# EasyEDA Pro project wavie-led-array.epro

# Schematic Schematic1
Board Name: Board1; Create Date: 2026-07-01; Page Name: P1; Project Name: WavieLEDArray; Schematic Name: Schematic1; Update Date: 2026-07-30; Company: ReefMetrics; Page Size: A4; Version: V1.0
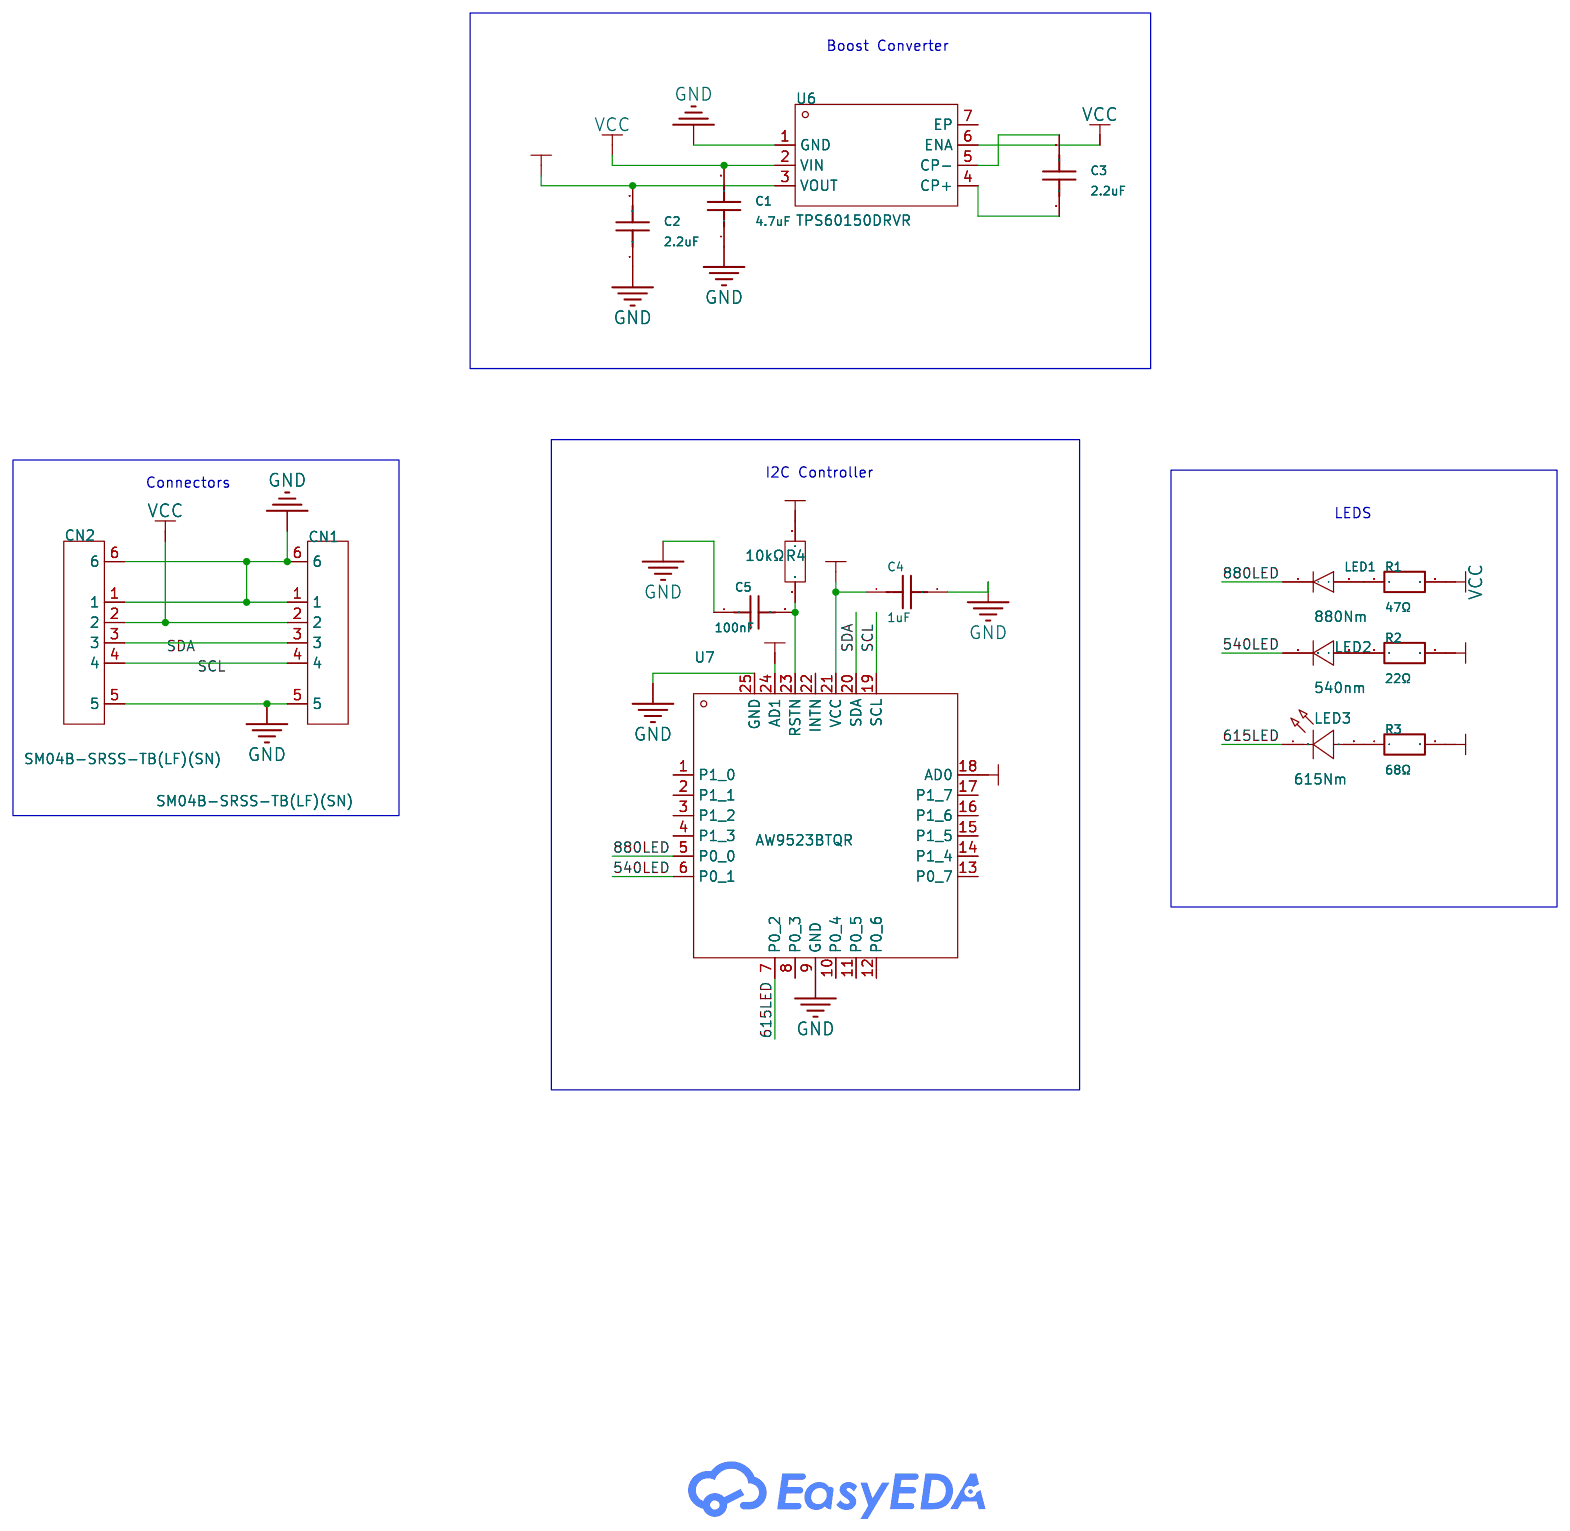
[diagram p0: schematic sheet]

## Parts
C1  4.7uF  [C0603]
C2  2.2uF  [C0603]
C3  2.2uF  [C0603]
C4  1uF  [C0402]
C5  100nF  [C0402]
CN1  SM04B-SRSS-TB(LF)(SN)  [CONN-SMD_4P-P1.00_SM04B-SRSS-TB-LF-SN]
CN2  SM04B-SRSS-TB(LF)(SN)  [CONN-SMD_4P-P1.00_SM04B-SRSS-TB-LF-SN]
LED1  880Nm  [LED0603-RD_XZTHI53W]
LED2  540nm  [LED0603-RD]
LED3  615Nm  [LED0603-RD_1]
R1  47Ω  [R0402]
R2  22Ω  [R0402]
R3  68Ω  [R0402]
R4  10kΩ  [R0402]
U6  TPS60150DRVR  [QFN-6_L2.0-W2.0-P0.65-TL-EP]
U7  AW9523BTQR  [VFQFPN-24_L4.0-W4.0-P0.50-BL-EP2.8]

## Library data of the parts
C1 = TCC0603X7S475K100CTM: Capacitance:4.7uF Tolerance:±10% Tolerance:±10% Voltage Rating:10V Temperature Coefficient:X7S; LCSC Part Name: 4.7uF ±10% 10V; Supplier Part: C54934689; Manufacturer: CCTC(三环); Supplier Footprint: 0603; JLCPCB Part Class: Extended Part; Datasheet: https://item.szlcsc.com/datasheet/TCC0603X7S475K100CTM/58488607.html; Supplier: LCSC; Tolerance: ±10%; Voltage Rating: 10V; Temperature Coefficient: X7S
C2 C3 = 0603X5R225M500NT: Capacitance:2.2uF Tolerance:±20% Tolerance:±20% Voltage Rating:50V Temperature Coefficient:X5R; LCSC Part Name: 2.2uF ±20% 50V; Supplier Part: C49326374; Manufacturer: AIDE(爱迪电容); Supplier Footprint: 0603; JLCPCB Part Class: Extended Part; Datasheet: https://item.szlcsc.com/datasheet/0603X5R225M500NT/51802403.html; Supplier: LCSC; Tolerance: ±20%; Voltage Rating: 50V; Temperature Coefficient: X5R
C4 = 0402ZD105KAT4A: Capacitance:1uF Tolerance:±10% Tolerance:±10% Voltage Rating:10V Temperature Coefficient:X5R; LCSC Part Name: 1uF ±10% 10V; Supplier Part: C6774932; Manufacturer: Kyocera AVX; Supplier Footprint: 0402; JLCPCB Part Class: Extended Part; Supplier: LCSC; Tolerance: ±10%; Voltage Rating: 10V; Temperature Coefficient: X5R
C5 = TCC0402X7R104K500ATM: Capacitance:100nF Tolerance:±10% Tolerance:±10% Voltage Rating:50V Temperature Coefficient:X7R; LCSC Part Name: 100nF ±10% 50V; Supplier Part: C48543623; Manufacturer: CCTC(三环); Supplier Footprint: 0402; JLCPCB Part Class: Extended Part; Datasheet: https://item.szlcsc.com/datasheet/TCC0402X7R104K500ATM/50806393.html; Supplier: LCSC; Tolerance: ±10%; Voltage Rating: 50V; Temperature Coefficient: X7R
CN1 CN2 = SM04B-SRSS-TB(LF)(SN): Pins Structure:1x4P Pitch:1mm Mounting Type:Surface Mount, Right Angle Reference Series:SH Number of Pins:4P Number of Rows:1 Number of PINs Per Row:4 Row Spacing:- Current Rating:1A Contact Material:Copper alloy Contact Plating:Tin Operating Temperature:; LCSC Part Name: 1x4P 间距:1mm 卧贴 系列:SH; Supplier Part: C160404; Manufacturer: JST; Supplier Footprint: SMD,P=1mm,卧贴; JLCPCB Part Class: Extended Part; Datasheet: https://item.szlcsc.com/datasheet/SM04B-SRSS-TB(LF)(SN)/171784.html; Supplier: LCSC; Pins Structure: 1x4P; Pitch: 1mm; Mounting Type: Surface Mount, Right Angle; Reference Series: SH; Number of Pins: 4P; Number of Rows: 1; Number of PINs Per Row: 4; Current Rating: 1A; Contact Material: Copper alloy; Contact Plating: Tin; Operating Temperature: -25℃~+85℃; Voltage Rating: 50V; Plastic Material: PA; Flame Retardant Rating: UL94V-0; Supplementary Features: Auxiliary Solder Pin; Color: White; Z-Height of the Board: 2.9mm; X-Length of Bottom Edge on Board (Spacing Line): 6mm; Y-Width of Bottom Edge on Board: 4.32mm
LED1 = XZTHI53W: Voltage - Forward(Vf):1.3V Voltage - Forward(Vf):1.3V Wavelength:880nm Wavelength:880nm Radiant Intensity:- Operating Temperature:-40℃~+85℃ Operating Temperature:-40℃~+85℃; Supplier Part: C6759194; Manufacturer: SunLED; Supplier Footprint: 0603; JLCPCB Part Class: Extended Part; Datasheet: https://item.szlcsc.com/datasheet/XZTHI53W/7717299.html; Supplier: LCSC; Voltage - Forward(Vf): 1.3V; Wavelength: 880nm; Operating Temperature: -40℃~+85℃
LED2 = LT Q39G-Q1OO-25-1-5-R18: Lamp Holder Type:- Illumination Color:Emerald Green Voltage - Forward(Vf):2.6V~3.1V Voltage - Forward(Vf):2.6V~3.1V Power(Watts):- Forward Current:- Wavelength - Dominant:520nm~540nm Wavelength - Dominant:520nm~540nm Peak Wavelength:525nm Peak Wavelength:; LCSC Part Name: 0603翠绿; Supplier Part: C2900033; Manufacturer: OSRAM(欧司朗); Datasheet: https://item.szlcsc.com/datasheet/LT%2520Q39G-Q1OO-25-1-5-R18/3147960.html; Supplier: LCSC; Illumination Color: Emerald Green; Voltage - Forward(Vf): 2.6V~3.1V; Wavelength - Dominant: 520nm~540nm; Peak Wavelength: 525nm; Lens Color: Water Clear; Luminous Intensity: 71mcd~90mcd; Viewing Angle: 170°; Operating Temperature: -30℃~+85℃
LED3 = SML-D14U2WT86A: Illumination Color:Red Voltage - Forward(Vf):2V Voltage - Forward(Vf):2V Power(Watts):75mW Forward Current:20mA Wavelength - Dominant:615nm Wavelength - Dominant:615nm Diode Configuration:Discrete Diode Lens Color:- Luminous Intensity:160mcd Luminous Inte; LCSC Part Name: 高亮度高可靠性器件; Supplier Part: C5336696; Manufacturer: ROHM(罗姆); Supplier Footprint: 0603; JLCPCB Part Class: Extended Part; Datasheet: https://item.szlcsc.com/datasheet/SML-D14U2WT86A/6102060.html; Supplier: LCSC; Illumination Color: Red; Voltage - Forward(Vf): 2V; Power(Watts): 75mW; Forward Current: 20mA; Wavelength - Dominant: 615nm; Diode Configuration: Discrete Diode; Luminous Intensity: 160mcd; Mounting Style: Top-mount; Operating Temperature: -40℃~+100℃
R1 = 1RC0402F4709: Type:Thick Film Resistor Resistance:47Ω Tolerance:±1% Tolerance:±1% Power(Watts):62.5mW Voltage-Supply(Max):50V Temperature Coefficient:±100ppm/℃ Temperature Coefficient:±100ppm/℃ Operating Temperature:-55℃~+155℃ Operating Temperature:-55℃~+155℃; LCSC Part Name: 厚膜电阻±1%47Ω±100ppm/℃; Supplier Part: C54530894; Manufacturer: SAE(世盟/世爱); Supplier Footprint: 0402; JLCPCB Part Class: Extended Part; Datasheet: https://item.szlcsc.com/datasheet/1RC0402F4709/57883504.html; Supplier: LCSC; Type: Thick Film Resistor; Tolerance: ±1%; Power(Watts): 62.5mW; Voltage-Supply(Max): 50V; Temperature Coefficient: ±100ppm/℃; Operating Temperature: -55℃~+155℃
R2 = 1RC0402F2209: Type:Thick Film Resistor Resistance:22Ω Tolerance:±1% Tolerance:±1% Power(Watts):62.5mW Voltage-Supply(Max):50V Temperature Coefficient:±400ppm/℃ Temperature Coefficient:±400ppm/℃ Operating Temperature:-55℃~+155℃ Operating Temperature:-55℃~+155℃; LCSC Part Name: 厚膜電阻 +1% 22Ω; Supplier Part: C53224179; Manufacturer: SAE(世盟/世爱); Supplier Footprint: 0402; JLCPCB Part Class: Extended Part; Datasheet: https://item.szlcsc.com/datasheet/1RC0402F2209/56267215.html; Supplier: LCSC; Type: Thick Film Resistor; Tolerance: ±1%; Power(Watts): 62.5mW; Voltage-Supply(Max): 50V; Temperature Coefficient: ±400ppm/℃; Operating Temperature: -55℃~+155℃
R3 = TC0225B680JTCC: Type:Thin Film Resistor Resistance:68Ω Tolerance:±0.1% Tolerance:±0.1% Power(Watts):62.5mW Temperature Coefficient:±25ppm/℃ Temperature Coefficient:±25ppm/℃; LCSC Part Name: 薄膜电阻 68Ω ±0.1% 62.5mW; Supplier Part: C29604897; Manufacturer: UNI-ROYAL(厚声); Supplier Footprint: 0402; JLCPCB Part Class: Extended Part; Datasheet: https://item.szlcsc.com/datasheet/TC0225B680JTCC/31331008.html; Supplier: LCSC; Type: Thin Film Resistor; Tolerance: ±0.1%; Power(Watts): 62.5mW; Temperature Coefficient: ±25ppm/℃
R4 = ARG02DTC1002: Type:Thin Film Resistor Resistance:10kΩ Tolerance:±0.5% Tolerance:±0.5% Power(Watts):62.5mW Voltage-Supply(Max):50V Temperature Coefficient:±25ppm/℃ Temperature Coefficient:±25ppm/℃ Operating Temperature:-55℃~+155℃ Operating Temperature:-55℃~+155℃; LCSC Part Name: 薄膜电阻 10kΩ ±0.5% 62.5mW; Supplier Part: C3024422; Manufacturer: Viking(光颉); Supplier Footprint: 0402; JLCPCB Part Class: Extended Part; Datasheet: https://item.szlcsc.com/datasheet/ARG02DTC1002/3551082.html; Supplier: LCSC; Type: Thin Film Resistor; Tolerance: ±0.5%; Power(Watts): 62.5mW; Voltage-Supply(Max): 50V; Temperature Coefficient: ±25ppm/℃; Operating Temperature: -55℃~+155℃
U6 = TPS60150DRVR: Function:boost converter Operating Voltage:2.7V~5.5V Operating Voltage:2.7V~5.5V Output Voltage:4.8V~5.2V Output Voltage:4.8V~5.2V Output Current:140mA Quiescent Current:90uA Output Resistance:- Energy Efficiency:- Switching Frequency:1.5MHz PFM Mode:Not; LCSC Part Name: 5-V, 140-mA电荷泵; Supplier Part: C182429; Manufacturer: TI(德州仪器); Supplier Footprint: WSON-6-EP(2x2); JLCPCB Part Class: Extended Part; Datasheet: https://www.ti.com/cn/lit/ds/symlink/tps60150.pdf; Supplier: LCSC; Function: boost converter; Operating Voltage: 2.7V~5.5V; Output Voltage: 4.8V~5.2V; Output Current: 140mA; Quiescent Current: 90uA; Switching Frequency: 1.5MHz; PFM Mode: Not supported; Operating Temperature: -40℃~+85℃; Features: Overcurrent Protection；Soft-start；Output short-circuit protection
U7 = AW9523BTQR: Interface:I2C Number of I/O:16 Interrupt Output:Interrupt Output Output Type:Push-Pull；Open-drain Current - Output Low(IOL):20mA Current - Output High(IOH):- Clock Frequency:400kHz Number of Supporting Devices:4 Quiescent Supply Current:100nA Output Logic; LCSC Part Name: AW9523B产品手册; Supplier Part: C148077; Manufacturer: AWINIC(艾为); Supplier Footprint: TQFN-24-EP(4x4); Datasheet: https://item.szlcsc.com/datasheet/AW9523BTQR/159410.html; Supplier: LCSC; Interface: I2C; Number of I/O: 16; Interrupt Output: Interrupt Output; Output Type: Push-Pull；Open-drain; Current - Output Low(IOL): 20mA; Clock Frequency: 400kHz; Number of Supporting Devices: 4; Quiescent Supply Current: 100nA; Output Logic Level - Low: 60mV; Features: Built-in LED driver；Reset function；Cascade and address expansion；IO level configurable；Input anti-jitter; Voltage - Supply: 2.4V~5.5V; Operating Temperature: -40℃~+85℃

## Nets
5V: C2.2 C4.1 R2.2 R3.2 R4.1 U6.3(VOUT) U7.18(AD0) U7.21(VCC) U7.24(AD1)
GND: C1.1 C2.1 C4.2 C5.1 CN1.1 CN1.5 CN1.6 CN2.1 CN2.5 CN2.6 U6.1(GND) U7.9(GND) U7.25(GND)
VCC: C1.2 CN1.2 CN2.2 R1.2 U6.2(VIN) U6.6(ENA)
540LED: LED2.1(C) U7.6(P0_1)
615LED: LED3.1(C) U7.7(P0_2)
880LED: LED1.1(-) U7.5(P0_0)
SCL: CN1.4 CN2.4 U7.19(SCL)
SDA: CN1.3 CN2.3 U7.20(SDA)
$1N5156: C3.2 U6.5(CP-)
$1N5165: C3.1 U6.4(CP+)
$1N9825: LED1.2(+) R1.1
$1N9830: LED2.2(A) R2.1
$1N9835: LED3.2(A) R3.1
$1N9899: C5.2 R4.2 U7.23(RSTN)

Not connected (* = marked no-connect by the designer): U6 7(EP); U7 1(P1_0) 2(P1_1) 3(P1_2) 4(P1_3) 8(P0_3) 10(P0_4) 11(P0_5) 12(P0_6) 13(P0_7) 14(P1_4) 15(P1_5) 16(P1_6) 17(P1_7) 22(INTN)

## Notes on the sheet
- Boost Converter
- I2C Controller
- Connectors
- LEDS

# Board PCB2
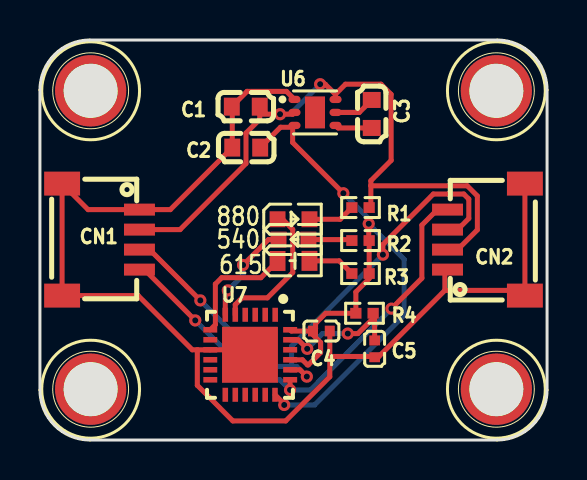
[diagram p1: board, top side]
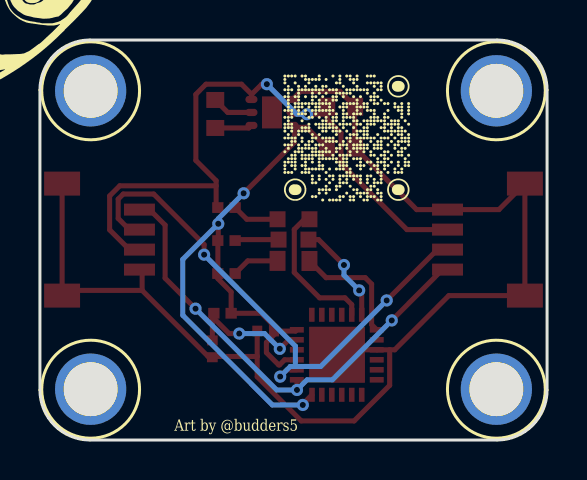
[diagram p2: board, bottom side, seen from below]

Outline 25.4 x 20 mm; copper layers: Top Layer, Bottom Layer. Coordinates in mm from the lower left corner of the outline.
Outline path: 0,17.5 arc(0.73,19.27) 2.5,20 22.9,20 arc(24.67,19.27) 25.4,17.5 25.4,2.5 arc(24.67,0.73) 22.9,0 2.5,0 arc(0.73,0.73) 0,2.5 0,17.5
Stack: Top Layer 0.035mm / Dielectric1 1.51mm FR4 er 4.5 / Bottom Layer 0.035mm

## Design rules (mm)
template: JLCPCB Capability(Two Layers Board)
spacing copperThickness1oz (default): track to track 0.102, other pairs 0.152 to 0.3
spacing copperThickness2oz: track to track 0.203, other pairs 0.152 to 0.3
track width copperThickness1oz (default): min 0.127, default 0.254, max 2.54
track width copperThickness2oz: min 0.203, default 0.254, max 2.54
differential pair differentialPair (default): width min 0.127, default 0.254, max 2.54; gap min 0.152, default 0.152
via viaSize (default): diameter min 0.5, default 0.61, max 10; hole min 0.3, default 0.305, max 6.3

## Placement (name value [footprint] x y rotation side)
C1  4.7uF  [C0603]  10.31 16.67 0 top
C2  2.2uF  [C0603]  10.33 14.62 0 top
C3  2.2uF  [C0603]  16.62 16.3 90 top
C4  1uF  [C0402]  14.1 5.45 0 top
C5  100nF  [C0402]  16.76 4.56 90 top
CN1  SM04B-SRSS-TB(LF)(SN)  [CONN-SMD_4P-P1.00_SM04B-SRSS-TB-LF-SN]  3.05 10.02 270 top
CN2  SM04B-SRSS-TB(LF)(SN)  [CONN-SMD_4P-P1.00_SM04B-SRSS-TB-LF-SN]  22.35 10.02 90 top
LED1  880Nm  [LED0603-RD_XZTHI53W]  12.7 11.04 0 top
LED2  540nm  [LED0603-RD]  12.7 10.02 0 top
LED3  615Nm  [LED0603-RD_1]  12.7 8.95 0 top
M1  MountingHole_2.5mm_Pad  [custom_mount_hole:MountingHole_2.5mm_Pad]  2.54 17.46 0 top
M2  MountingHole_2.5mm_Pad  [custom_mount_hole:MountingHole_2.5mm_Pad]  22.86 17.46 0 top
M3  MountingHole_2.5mm_Pad  [custom_mount_hole:MountingHole_2.5mm_Pad]  22.86 2.54 0 top
M4  MountingHole_2.5mm_Pad  [custom_mount_hole:MountingHole_2.5mm_Pad]  2.54 2.54 0 top
R1  47Ω  [R0402]  16.06 11.62 0 top
R2  22Ω  [R0402]  16.06 9.97 0 top
R3  68Ω  [R0402]  16.06 8.32 0 top
R4  10kΩ  [R0402]  16.26 6.34 0 top
U6  TPS60150DRVR  [QFN-6_L2.0-W2.0-P0.65-TL-EP]  13.78 16.38 0 top
U7  AW9523BTQR  [VFQFPN-24_L4.0-W4.0-P0.50-BL-EP2.8]  10.53 4.26 180 top

## Footprints (pads in the part's own frame, mm; a bottom-side part is the same pattern mirrored in y, then rotated)
C0402
  rect 0.5x0.54 smd: 1(-0.42,0) 2(0.42,0)
C0603
  rect 0.8x0.9 smd: 1(-0.7,0) 2(0.7,0)
CONN-SMD_4P-P1.00_SM04B-SRSS-TB-LF-SN
  rect 0.6x1.55 smd: 1(-1.5,1.938) 2(-0.5,1.938) 3(0.5,1.938) 4(1.5,1.938)
  rect 1.2x1.8 smd: 5(2.8,-1.938) 6(-2.8,-1.938)
custom_mount_hole:MountingHole_2.5mm_Pad
  round 3.57 hole 2.7: ~(0,0)
LED0603-RD
  rect 0.8x0.8 smd: 1(-0.749,0) 2(0.749,0)
LED0603-RD_1
  rect 0.8x1 smd: 1(-0.799,-0.004) 2(0.799,0.004)
LED0603-RD_XZTHI53W
  rect 0.8x0.8 smd: 1(-0.799,0) 2(0.799,0)
QFN-6_L2.0-W2.0-P0.65-TL-EP
  oval 0.607x0.364 smd: 1(-1.028,0.65) 2(-1.028,0) 3(-1.028,-0.65) 4(1.028,-0.65) 5(1.028,0) 6(1.028,0.65)
  rect 1x1.6 smd: 7(0,0)
R0402
  rect 0.566x0.54 smd: 1(-0.433,0) 2(0.433,0)
VFQFPN-24_L4.0-W4.0-P0.50-BL-EP2.8
  rect 0.28x0.7 smd: 1(-1.25,-2) 2(-0.75,-2) 3(-0.25,-2) 4(0.25,-2) 5(0.75,-2) 6(1.25,-2) 13(1.25,2) 14(0.75,2) 15(0.25,2) 16(-0.25,2) 17(-0.75,2) 18(-1.242,2)
  rect 0.7x0.28 smd: 7(2,-1.25) 8(2,-0.75) 9(2,-0.25) 10(2,0.25) 11(2,0.75) 12(2,1.25) 19(-2,1.25) 20(-2,0.75) 21(-2,0.25) 22(-2,-0.25) 23(-2,-0.75) 24(-2,-1.25)
  rect 2.8x2.8 smd: 25(0.013,0)

## Nets
As in the schematic.

Pads without a net: M1 ~; M2 ~; M3 ~; M4 ~; U6 7; U7 1 2 3 4 8 10 11 12 13 14 15 16 17 22

## Via types
v1: diameter 0.61, hole 0.305, Top Layer to Bottom Layer, 15 vias

## Routing (per net, layer and track width the routed paths; a pad name or vN(x,y) marks a point on that pad's centre or on a via; arc(x,y) is an arc through that point)
5V: length 34.2
  Top Layer w0.254: U7.18 12.24,1.8 v1(12.24,1.75) ; v1(15.2,12.33) 12.66,14.88 12.66,15.64 ; 13.49,5.45 14.06,4.88 14.06,4.37 13.44,3.76 13.4,3.76 13.14,4.01 U7.21 ; 13.49,5.45 12.59,5.45 U7.24 ; 13.49,5.45 C4.1 13.8,5.58 13.8,5.83 14.31,6.34 R4.1 15.82,7.4 16.49,8.07 R3.2 R2.2 16.47,9.99 v1(16.47,10.81) ; 12.66,15.64 12.05,15.64 C2.2 ; 12.66,15.64 U6.3
  Bottom Layer w0.254: v1(15.2,12.33) 16.47,11.06 v1(16.47,10.81) 18.25,9.03 18.25,6.24 13.76,1.75 v1(12.24,1.75)
GND: length 62.6
  Top Layer w0.254: 14.52,4.18 14.52,3.16 12.31,0.95 9.66,0.95 7.88,2.73 7.88,4.51 ; 14.52,4.18 C4.2 ; 14.52,4.18 16.72,4.18 ; CN2.1 20.28,8.39 20.28,7.48 ; U6.1 12.35,17.43 10.37,17.43 C1.1 9.63,16.65 C2.1 6.53,11.52 CN1.1 2.41,11.52 CN1.6 CN1.5 4.92,7.22 7.63,4.51 7.88,4.51 ; CN2.5 CN2.6 24.03,7.48 20.28,7.48 ; 20.28,7.48 16.98,4.18 16.72,4.18 ; 7.88,4.51 U7.9 10.27,4.51 U7.25 ; 16.72,4.18 C5.1
VCC: length 33.9
  Top Layer w0.254: v1(14.03,17.79) 14.29,17.79 14.8,17.28 ; 14.8,17.28 15.3,17.79 17.08,17.79 17.59,17.28 17.59,13.98 16.57,12.96 16.57,12.71 ; 14.8,17.28 U6.6 ; CN1.2 7.02,10.52 10.32,13.82 10.32,15.35 11.01,16.04 11.01,16.29 ; U6.2 12.66,16.29 v1(12.03,16.29) 11.01,16.29 ; 11.01,16.29 C1.2 ; 16.57,12.71 21.4,12.71 21.91,12.2 21.91,10.51 20.92,9.52 CN2.2 ; 16.57,12.71 16.57,11.71 R1.2
  Bottom Layer w0.254: v1(14.03,17.79) 12.53,16.29 v1(12.03,16.29)
540LED: length 5.2
  Top Layer w0.254: LED2.1 11.44,10.02 v1(10.17,8.75) ; U7.6 9.28,7.35 v1(9.41,7.48)
  Bottom Layer w0.254: v1(10.17,8.75) 10.17,8.24 v1(9.41,7.48)
615LED: length 6
  Top Layer w0.254: U7.7 8.79,5.76 8.79,7.8 9.11,8.12 11.07,8.12 LED3.1
880LED: length 7.2
  Top Layer w0.254: U7.5 9.78,6.77 10.12,7.11 11.39,7.11 12.66,8.38 12.66,10.53 12.15,11.04 LED1.1
SCL: length 23.7
  Top Layer w0.254: CN1.4 5.24,8.52 v1(7.78,5.98) ; v1(17.61,6.57) 19.13,8.09 19.13,10.74 19.91,11.52 CN2.4 ; v1(12.53,2.5) 12.53,3
  Bottom Layer w0.254: v1(7.78,5.98) 10.75,3.01 12.02,3.01 v1(12.53,2.5) 13.54,2.5 v1(17.61,6.57)
SDA: length 27.7
  Top Layer w0.254: CN1.3 5.49,9.52 v1(8.03,6.98) ; U7.20 13.03,3.51 v1(13.37,3.17) ; v1(17.18,9.27) 17.18,9.77 19.7,12.3 21.23,12.3 21.48,12.04 21.48,11.08 20.97,10.57 20.46,10.57 CN2.3
  Bottom Layer w0.254: v1(13.37,3.17) 12.86,3.68 12.61,3.68 ; v1(8.03,6.98) 11.34,3.68 12.61,3.68 ; 12.61,3.68 12.61,4.69 v1(17.18,9.27)
$1N5156: length 2.1
  Top Layer w0.254: U6.5 15.99,16.38 C3.2
$1N5165: length 1.9
  Top Layer w0.254: U6.4 14.93,15.6 C3.1
$1N9825: length 2.4
  Top Layer w0.254: R1.1 15.04,11.04 LED1.2
$1N9830: length 2.2
  Top Layer w0.254: R2.1 15.58,10.02 LED2.2
$1N9835: length 2.4
  Top Layer w0.254: R3.1 14.99,8.96 LED3.2
$1N9899: length 6.6
  Top Layer w0.254: C5.2 16.76,6.26 R4.2 16.69,6.08 15.93,5.32 v1(15.42,5.32) ; U7.23 12.94,5.01 v1(13.39,4.56)
  Bottom Layer w0.254: v1(15.42,5.32) 14.15,5.32 v1(13.39,4.56)

## Text on the board
Bottom Silkscreen Layer: Art by @budders5
Top Silkscreen Layer: 880 | 540 | 615
